# Altium schematic sheet HV Power.SchDoc
size A; SheetNumber: 1; SheetTotal: 6
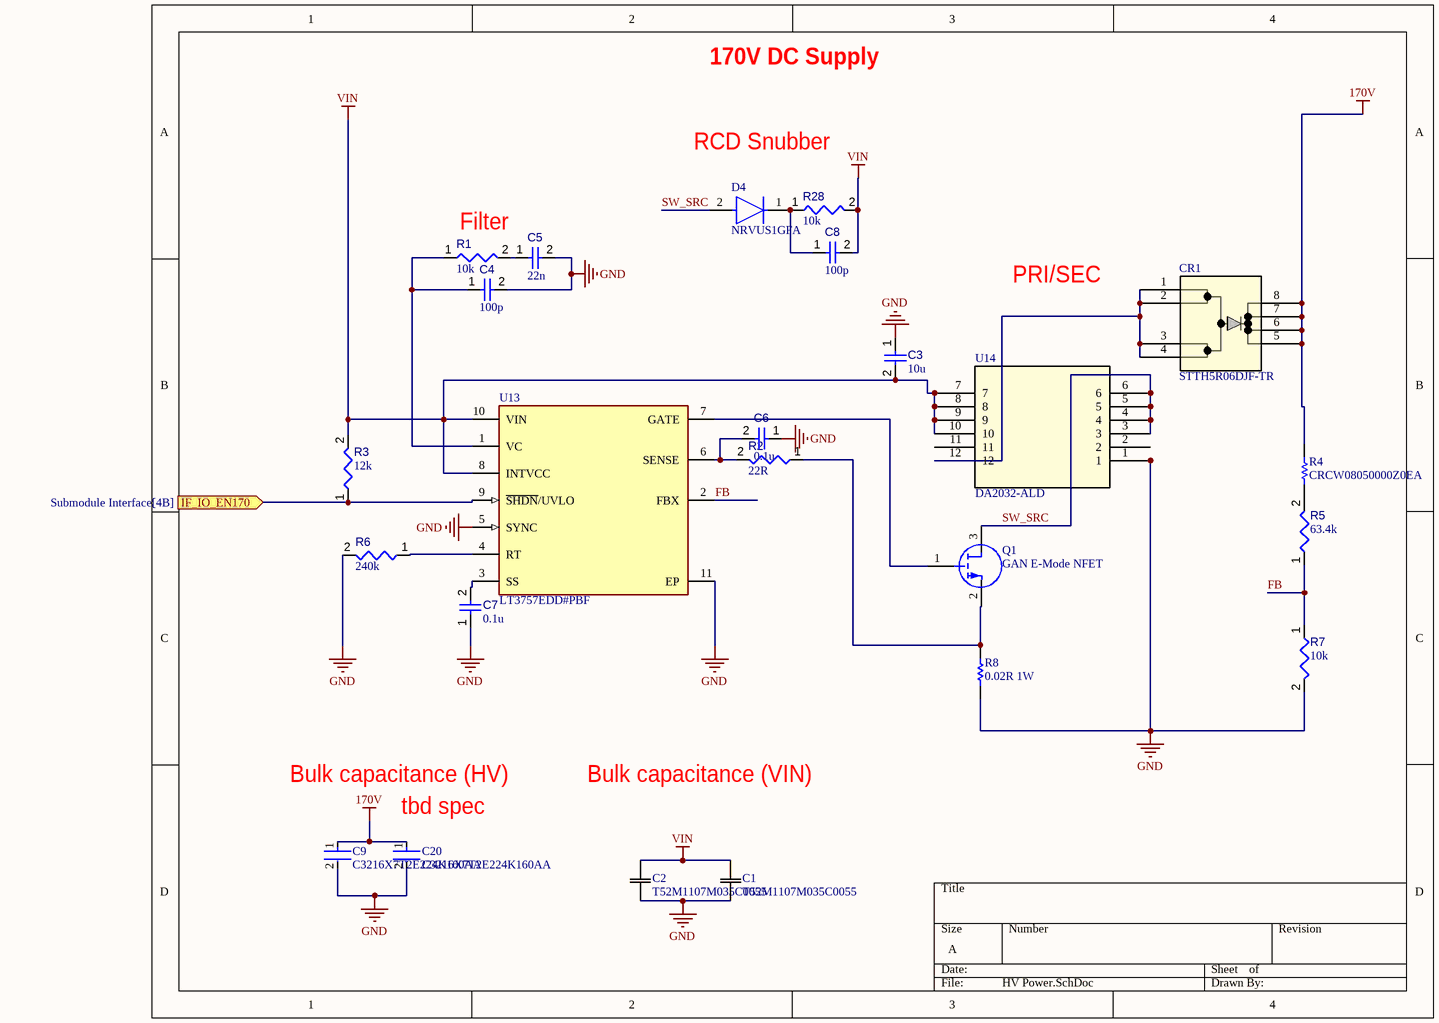
[diagram p0: HV Power.SchDoc]

## Parts
C1  T52M1107M035C0055  [CAP_35C0055_VIS]
C2  T52M1107M035C0055  [CAP_35C0055_VIS]
C3  value 10u  [CAPC0402(1005)60_L]  (hidden comment: Capacitor 10µF +/-40% 6.3V 0402)
C4  value 100p  [CAPC0402(1005)60_L]  (hidden comment: Capacitor 10µF +/-40% 6.3V 0402)
C5  value 22n  [CAPC0402(1005)60_L]  (hidden comment: Capacitor 10µF +/-40% 6.3V 0402)
C6  value 0.1u  [CAPC0402(1005)60_L]  (hidden comment: Capacitor 10µF +/-40% 6.3V 0402)
C7  value 0.1u  [CAPC0402(1005)60_L]  (hidden comment: Capacitor 10µF +/-40% 6.3V 0402)
C8  value 100p  [CAPC0402(1005)60_L]  (hidden comment: Capacitor 10µF +/-40% 6.3V 0402)
C9  C3216X7T2E224K160AA  [FP-C3216-160-0_2-IPC_C]
C20  C3216X7T2E224K160AA  [FP-C3216-160-0_2-IPC_C]
CR1  STTH5R06DJF-TR  [POWERFLAT5X6_STM]
D4  NRVUS1GFA  [FP-425AB-MFG]
Q1  GAN E-Mode NFET  [PCBComponent_1]
R1  value 10k  [RESC1005X40X25ML05T05]  (hidden comment: Resistor 10k +/-1% 0402 63 mW)
R2  value 22R  [RESC1005X40X25ML05T05]  (hidden comment: Resistor 10k +/-1% 0402 63 mW)
R3  value 12k  [RESC1005X40X25ML05T05]  (hidden comment: Resistor 10k +/-1% 0402 63 mW)
R4  CRCW08050000Z0EA  [RESC2013X50X30LL20T20]
R5  value 63.4k  [RESC1005X40X25ML05T05]  (hidden comment: Resistor 10k +/-1% 0402 63 mW)
R6  value 240k  [RESC1005X40X25ML05T05]  (hidden comment: Resistor 10k +/-1% 0402 63 mW)
R7  value 10k  [RESC1005X40X25ML05T05]  (hidden comment: Resistor 10k +/-1% 0402 63 mW)
R8  0.02R 1W  [RESC3225X70X50NL20T20]
R28  value 10k  [RESC1005X40X25ML05T05]  (hidden comment: Resistor 10k +/-1% 0402 63 mW)
U13  LT3757EDD#PBF  [FP-DD-10-05-08-1699-IPC_A]
U14  DA2032-ALD  [SOIC12_LT3750_DA2032_14P98X17P2_COC]

## Ports
IF_IO_EN170 (in, see Submodule Interface[4B])

## Nets
170V: C9.1 C20.1 CR1.5 CR1.6 CR1.7 CR1.8 R4.2
GND: C1.1 C2.1 C3.1 C4.2 C5.2 C6.1 C7.1 C9.2 C20.2 R6.2 R7.2 R8.1 U13.5(SYNC) U13.11(EP) U14.1
VIN: C1.2 C2.2 C3.2 C8.2 R3.2 R28.2 U13.8(INTVCC) U13.10(VIN) U14.7 U14.8 U14.9 U14.10
FB: R5.1 R7.1 U13.2(FBX)
IF_IO_EN170: R3.1 U13.9(~{SHDN}/UVLO) ; port IF_IO_EN170
SW_SRC: D4.2(A) Q1.3(D) U14.3 U14.4 U14.5 U14.6
NetC4_1: C4.1 R1.1 U13.1(VC)
NetC5_1: C5.1 R1.2
NetC6_2: C6.2 R2.2 U13.6(SENSE)
NetC7_2: C7.2 U13.3(SS)
NetC8_1: C8.1 D4.1(C) R28.1
NetCR1_1: CR1.1 CR1.2 CR1.3 CR1.4 U14.12
NetQ1_1: Q1.1(G) U13.7(GATE)
NetQ1_2: Q1.2(S) R2.1 R8.2
NetR4_1: R4.1 R5.2
NetR6_1: R6.1 U13.4(RT)

Not connected (* = marked no-connect by the designer): U14 2 11

## Notes on the sheet
- 170V DC Supply
- RCD Snubber
- Filter
- PRI/SEC
- Bulk capacitance (HV)
- (near C20) tbd spec
- Bulk capacitance (VIN)

## Library data of the parts
C1 C2 = T52M1107M035C0055: No Description Available; Mfr_Name: Vishay
C3-C8 = CMP-001-00074-3: Chip Capacitor, 0.1µF +/-40%, 6.3V, 0402, Thickness 0.6 mm; Tolerance: 10%; Case/Package: 0402; Pins: 2; Mounting Technology: SMT; Voltage Rating: 6.3V; Max Operating Temperature: 85°C; Min Operating Temperature: -55°C
C9 C20 = CMP-08246-005598-1: Multilayer Ceramic Capacitors 220nF ±10% 250V X7T SMD 1206; Lead Free: Lead Free; Package Quantity: 1; Capacitance: 220nF; REACH SVHC: No SVHC; Min Operating Temperature: -55°C; Length: 0.126inch; Width: 0.063inch; Mount: Surface Mount; Case Code (Metric): 3216; Voltage Rating: 250V; Tolerance: 10%; Case Code (Imperial): 1206; Depth: 1.6mm; Series: C; Thickness: 0.075inch; RoHS Compliant: Yes; Voltage Rating (DC): 250V; Packaging: Tape and Reel; Max Operating Temperature: 125°C; Dielectric: X7T; Case/Package: 1206
CR1 = STTH5R06DJF-TR: No Description Available; Mfr_Name: STMicroelectronics; RefDes: RefDes; Type: Type
D4 = CMP-00278-106758013-1: NRVUS1GFA Rectifier Diode, 1 Phase, 1 Element, 1A, 400V V(RRM), Silicon; Manufacturer Lifecycle Status: ACTIVE, NOT REC; NexarPartId: 106758013; Lifecycle Status: NRND
Q1 = Component_1
R1-R3 R5-R7 R28 = CMP-009-00019-5: Chip Resistor, 12 KOhm, +/- 1%, 63 mW, -55 to 155 degC, 0402 (1005 Metric); Power: 63mW; Voltage Rating: 50V; Case/Package: 0402; Mounting Technology: SM; Pins: 2; Min Operating Temperature: -55°C; Tolerance: 1%; RoHS Compliant: True; Max Operating Temperature: 155°C
R4 = CMP-2001-04896-1: Manufacturer: Vishay Dale; Part Number: CRCW08050000Z0EA
R8 = CMP-2005-03839-2: Part Number: ERJ-L14KF20MU; Manufacturer: Panasonic
U13 = CMP-09139-000444-1: IC REG CTRLR MULT TOPOLOGY 10DFN; Max Input Voltage: 40V; Number of Output Phases: 1; Min Supply Voltage: 2.9V; Switching Frequency: 1MHz; Min Output Voltage: 1.569V; Max Output Voltage: 350V; Clock Sync: Yes; Output Current: 25A; Topology: Boost; Max Output Current: 12uA; Synchronous Rectifier: No; Height: 0.7mm; Number of Outputs: 1; Packaging: Rail/Tube; Max Supply Voltage: 40V; Min Operating Temperature: -40°C; Output Voltage: 350V; RoHS Compliant: Yes; Mount: Surface Mount; Number of Pins: 10; REACH SVHC: No SVHC; Width: 3mm; Case/Package: DFN; Min Input Voltage: 2.9V; Package Quantity: 121; Length: 3mm; Max Operating Temperature: 125°C
U14 = DA2032-ALD: No Description Available; Mfr_Name: Coilcraft; RefDes: RefDes; Type: Type